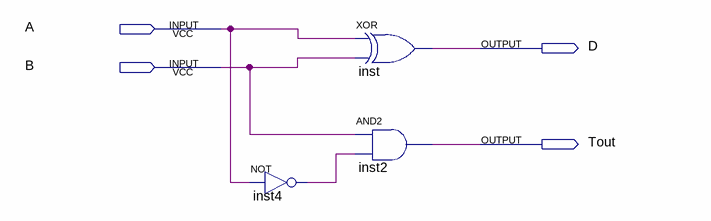
[diagram p0: schematic sheet]
// Quartus schematic MeioSubtrator.bdf as structural Verilog: 3 symbols, 4 pins
module MeioSubtrator (
  input  A,
  input  B,
  output D,
  output Tout
);

  wire inst4_out;

  not inst4 (inst4_out, A);
  xor inst (D, A, B);
  and inst2 (Tout, B, inst4_out);
endmodule
